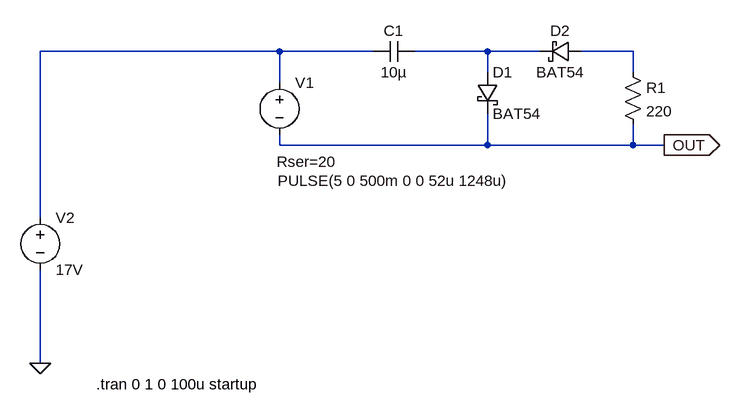
[diagram p0: schematic DriverA1.asc]
DriverA1.asc, the LTspice schematic file:
Version 4
SHEET 1 1000 680
WIRE 16 96 -352 96
WIRE 160 96 16 96
WIRE 336 96 224 96
WIRE 416 96 336 96
WIRE 560 96 480 96
WIRE 336 128 336 96
WIRE 560 128 560 96
WIRE 16 144 16 96
WIRE 16 240 16 224
WIRE 336 240 336 192
WIRE 336 240 16 240
WIRE 560 240 560 208
WIRE 560 240 336 240
WIRE 608 240 560 240
WIRE -352 352 -352 96
WIRE -352 576 -352 432
FLAG -352 576 0
FLAG 608 240 OUT
IOPIN 608 240 Out
SYMBOL voltage 16 128 R0
WINDOW 3 -3 167 Left 2
WINDOW 123 0 0 Left 0
WINDOW 39 -4 138 Left 2
SYMATTR InstName V1
SYMATTR Value PULSE(5 0 500m 0 0 52u 1248u)
SYMATTR SpiceLine Rser=20
SYMBOL cap 224 80 R90
WINDOW 0 0 32 VBottom 2
WINDOW 3 32 32 VTop 2
SYMATTR InstName C1
SYMATTR Value 10µ
SYMBOL schottky 320 128 R0
SYMATTR InstName D1
SYMATTR Value BAT54
SYMATTR Description Diode
SYMATTR Type diode
SYMBOL schottky 480 80 R90
WINDOW 0 0 32 VBottom 2
WINDOW 3 32 32 VTop 2
SYMATTR InstName D2
SYMATTR Value BAT54
SYMATTR Description Diode
SYMATTR Type diode
SYMBOL res 544 112 R0
SYMATTR InstName R1
SYMATTR Value 220
SYMBOL voltage -352 336 R0
WINDOW 123 0 0 Left 0
WINDOW 39 0 0 Left 0
SYMATTR InstName V2
SYMATTR Value 17V
TEXT -266 608 Left 2 !.tran 0 1 0 100u startup

The netlist it stands for:
* DriverA1.asc
V1 N001 OUT PULSE(5 0 500m 0 0 52u 1248u) Rser=20
C1 N002 N001 10µ
D1 N002 OUT BAT54
D2 N003 N002 BAT54
R1 N003 OUT 220
V2 N001 0 17V
.model D D
.lib standard.dio
.tran 0 1 0 100u startup
.backanno
.end